# EAGLE schematic mbc_90_23_11_25_dc (EAGLE 7.6.0)

## Sheet 1 of 3
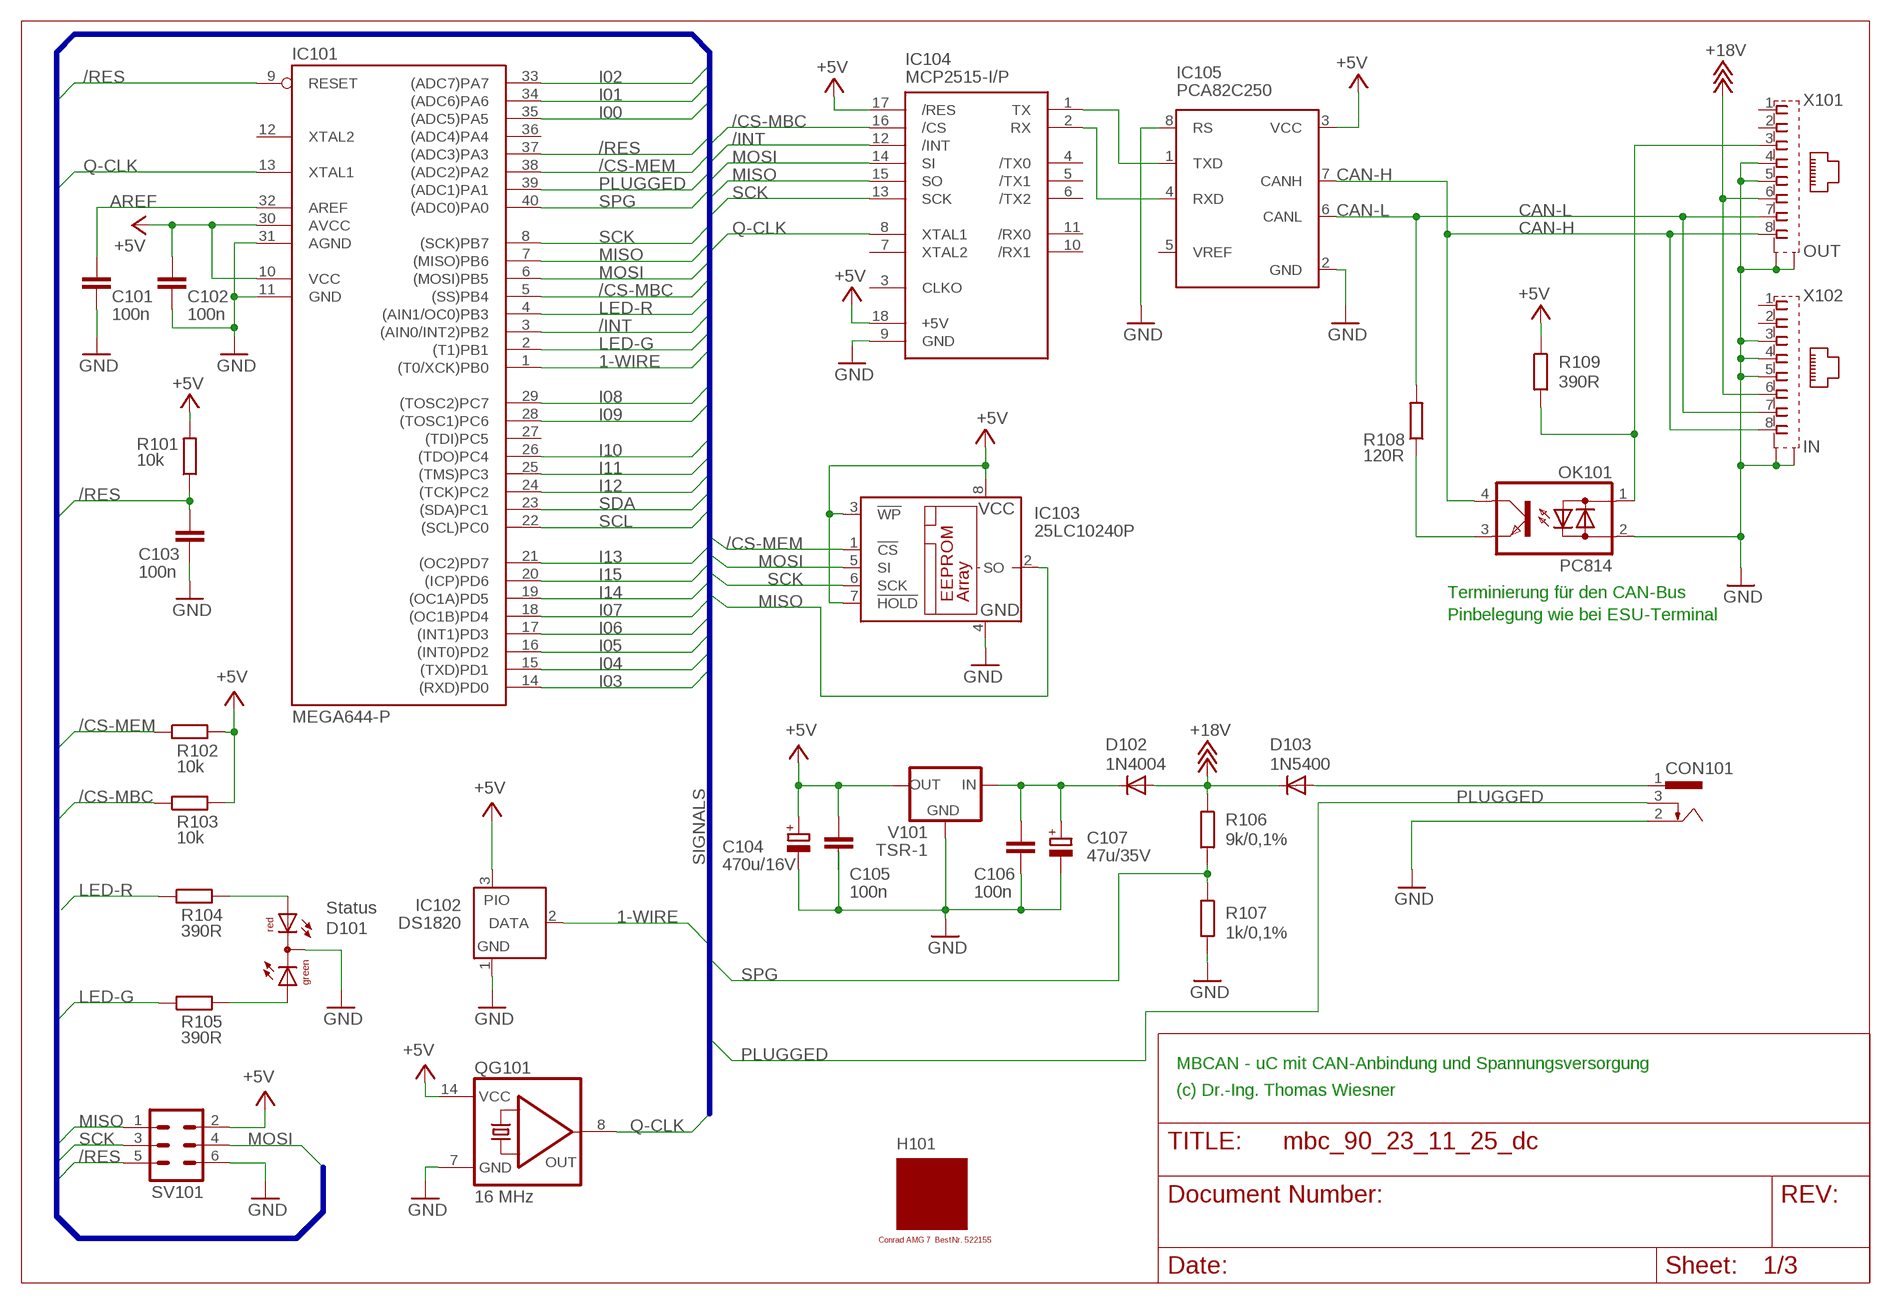
[diagram p0: schematic, sheet 1]

### Parts
C101  100n  C-EU025-025X050  [C025-025X050]
C102  100n  C-EU025-025X050  [C025-025X050]
C103  100n  C-EU025-025X050  [C025-025X050]
C104  470u/16V  CPOL-EUE3.5-8  [E3,5-8]
C105  100n  C-EU025-025X050  [C025-025X050]
C106  100n  C-EU025-025X050  [C025-025X050]
C107  47u/35V  CPOL-EUE2.5-7  [E2,5-7]
CON101  POWER-JACK  [POWER-JACK]
D101  Status  DUOLED5MM  [DUOLED5MM]
D102  1N4004  [DO41-10]
D103  1N5400  [DO201-15]
H101  MODULGEHÄUSE-AMG-7  [MODULGEHÄUSE-1]
IC101  MEGA644-P  MEGA323-P  [DIL40]
IC102  DS1820  DS2405  [TO92-]
IC103  25LC10240P  25LC040P  [DIL8]
IC104  MCP2515-I/P  MCP2510-I/P  [DIL18]
IC105  PCA82C250  [DIL08]
OK101  PC814  [DIL04]
QG101  16 MHz  QG5860  [DIL14S]
R101  10k  R-EU_0207/10  [0207/10]
R102  10k  R-EU_0207/10  [0207/10]
R103  10k  R-EU_0207/10  [0207/10]
R104  390R  R-EU_0207/10  [0207/10]
R105  390R  R-EU_0207/10  [0207/10]
R106  9k/0,1%  R-EU_0207/10  [0207/10]
R107  1k/0,1%  R-EU_0207/10  [0207/10]
R108  120R  R-EU_0207/10  [0207/10]
R109  390R  R-EU_0207/10  [0207/10]
SV101  ML6  [ML6]
V101  TSR-1  [TRACO-TSR-1]
X101  OUT  0446200002  [0446200002]
X102  IN  0446200002  [0446200002]

### Nets
1-WIRE: IC101.1((T0/XCK)PB0) IC102.2(DATA)
+5V: C102.1 C104.+ C105.1 IC101.10(VCC) IC101.30(AVCC) IC102.3(PIO) IC103.3(!WP) IC103.7(!HOLD) IC103.8(VCC) IC104.17(/RES) IC104.18(+5V) IC105.3(VCC) QG101.14(VCC) R101.2 R102.2 R103.2 R109.1 SV101.2 V101.OUT ; also sheet 2
+18V: D102.A D103.C R106.1 X101.6 X102.6
/CS-MBC: IC101.5((SS)PB4) IC104.16(/CS) R103.1
/CS-MEM: IC101.38((ADC2)PA2) IC103.1(!CS) R102.1
/INT: IC101.3((AIN0/INT2)PB2) IC104.12(/INT)
/RES: C103.1 IC101.9(RESET) IC101.37((ADC3)PA3) R101.1 SV101.5
AREF: C101.1 IC101.32(AREF)
CAN-H: IC105.7(CANH) OK101.4(C) X101.8 X102.8
CAN-L: IC105.6(CANL) R108.2 X101.7 X102.7
GND: C101.2 C102.2 C103.2 C104.- C105.2 C106.2 C107.- CON101.2 D101.K(C) IC101.11(GND) IC101.31(AGND) IC102.1(GND) IC103.4(GND) IC104.9(GND) IC105.2(GND) IC105.8(RS) QG101.7(GND) R107.2 SV101.6 V101.GND X101.4 X101.5 X101.S@1(S1) X101.S@2(S2) X102.3 X102.4 X102.5 X102.S@1(S1) X102.S@2(S2) ; also sheet 2
I00: IC101.35((ADC5)PA5) ; also sheet 2
I01: IC101.34((ADC6)PA6) ; also sheet 2
I02: IC101.33((ADC7)PA7) ; also sheet 2
I03: IC101.14((RXD)PD0) ; also sheet 2
I04: IC101.15((TXD)PD1) ; also sheet 2
I05: IC101.16((INT0)PD2) ; also sheet 2
I06: IC101.17((INT1)PD3) ; also sheet 2
I07: IC101.18((OC1B)PD4) ; also sheet 2
I08: IC101.29((TOSC2)PC7) ; also sheet 2
I09: IC101.28((TOSC1)PC6) ; also sheet 2
I10: IC101.26((TDO)PC4) ; also sheet 2
I11: IC101.25((TMS)PC3) ; also sheet 2
I12: IC101.24((TCK)PC2) ; also sheet 2
I13: IC101.21((OC2)PD7) ; also sheet 2
I14: IC101.19((OC1A)PD5) ; also sheet 2
I15: IC101.20((ICP)PD6) ; also sheet 2
LED-G: IC101.2((T1)PB1) R105.1
LED-R: IC101.4((AIN1/OC0)PB3) R104.1
MISO: IC101.7((MISO)PB6) IC103.2(SO) IC104.15(SO) SV101.1
MOSI: IC101.6((MOSI)PB5) IC103.5(SI) IC104.14(SI) SV101.4
N$1: IC104.1(TX) IC105.1(TXD)
N$2: IC104.2(RX) IC105.4(RXD)
N$4: OK101.3(E) R108.1
N$6: C106.1 C107.+ D102.C V101.IN
N$7: OK101.1(AC1) R109.2 X101.3
N$9: D101.AR R104.2
N$13: D101.AG R105.2
PLUGGED: CON101.3 IC101.39((ADC1)PA1)
Q-CLK: IC101.13(XTAL1) IC104.8(XTAL1) QG101.8(OUT)
SCK: IC101.8((SCK)PB7) IC103.6(SCK) IC104.13(SCK) SV101.3
SCL: IC101.22((SCL)PC0) ; also sheet 2
SDA: IC101.23((SDA)PC1) ; also sheet 2
SPG: IC101.40((ADC0)PA0) R106.2 R107.1
V-NETZTEIL1: CON101.1 D103.A
Unconnected: IC101.12(XTAL2) IC101.27((TDI)PC5) IC101.36((ADC4)PA4) IC104.3(CLKO) IC104.4(/TX0) IC104.5(/TX1) IC104.6(/TX2) IC104.7(XTAL2) IC104.10(/RX1) IC104.11(/RX0) IC105.5(VREF) OK101.2(AC2) X101.1 X101.2 X102.1 X102.2

### Buses
SIGNALS

### Notes on the sheet
- Terminierung für den CAN-Bus
- Pinbelegung wie bei ESU-Terminal
- MBCAN - uC mit CAN-Anbindung und Spannungsversorgung
- (c) Dr.-Ing. Thomas Wiesner

## Sheet 2 of 3
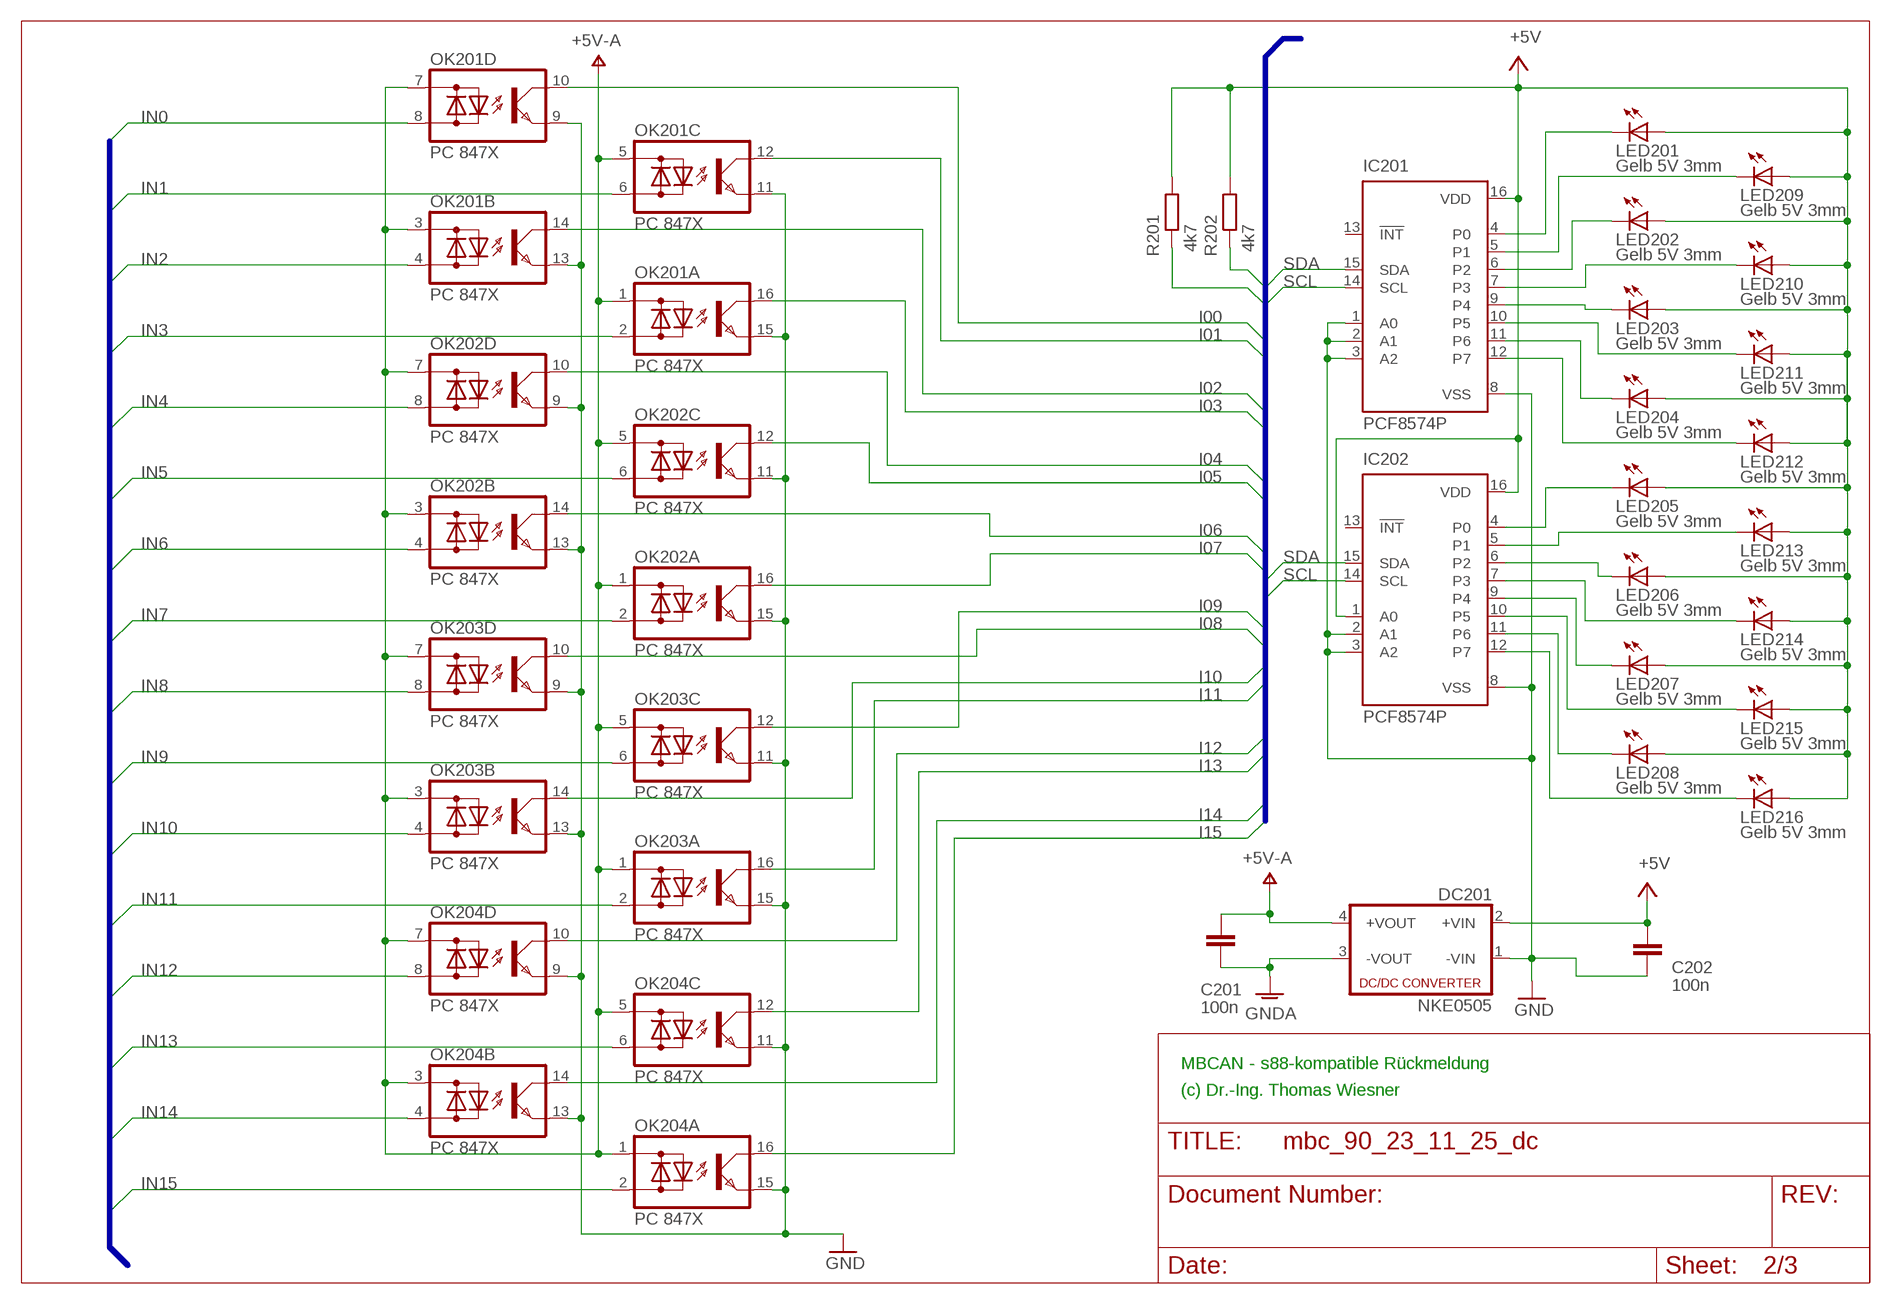
[diagram p1: schematic, sheet 2]

### Parts
C201  100n  C-EU025-025X050  [C025-025X050]
C202  100n  C-EU025-025X050  [C025-025X050]
DC201  NKE0505  NME  [NME]
IC201  PCF8574P  [DIL16]
IC202  PCF8574P  [DIL16]
LED201  Gelb 5V 3mm  LED3MM  [LED3MM]
LED202  Gelb 5V 3mm  LED3MM  [LED3MM]
LED203  Gelb 5V 3mm  LED3MM  [LED3MM]
LED204  Gelb 5V 3mm  LED3MM  [LED3MM]
LED205  Gelb 5V 3mm  LED3MM  [LED3MM]
LED206  Gelb 5V 3mm  LED3MM  [LED3MM]
LED207  Gelb 5V 3mm  LED3MM  [LED3MM]
LED208  Gelb 5V 3mm  LED3MM  [LED3MM]
LED209  Gelb 5V 3mm  LED3MM  [LED3MM]
LED210  Gelb 5V 3mm  LED3MM  [LED3MM]
LED211  Gelb 5V 3mm  LED3MM  [LED3MM]
LED212  Gelb 5V 3mm  LED3MM  [LED3MM]
LED213  Gelb 5V 3mm  LED3MM  [LED3MM]
LED214  Gelb 5V 3mm  LED3MM  [LED3MM]
LED215  Gelb 5V 3mm  LED3MM  [LED3MM]
LED216  Gelb 5V 3mm  LED3MM  [LED3MM]
OK201  PC 847X  TIL196  [DIL16]
OK202  PC 847X  TIL196  [DIL16]
OK203  PC 847X  TIL196  [DIL16]
OK204  PC 847X  TIL196  [DIL16]
R201  4k7  R-EU_0207/10  [0207/10]
R202  4k7  R-EU_0207/10  [0207/10]

### Nets
+5V: C202.1 DC201.2(+VIN) IC201.16(VDD) IC202.1(A0) IC202.16(VDD) LED201.A LED202.A LED203.A LED204.A LED205.A LED206.A LED207.A LED208.A LED209.A LED210.A LED211.A LED212.A LED213.A LED214.A LED215.A LED216.A R201.2 R202.2 ; also sheet 1
GND: C202.2 DC201.1(-VIN) IC201.1(A0) IC201.2(A1) IC201.3(A2) IC201.8(VSS) IC202.2(A1) IC202.3(A2) IC202.8(VSS) OK201.9(D:E) OK201.11(C:E) OK201.13(B:E) OK201.15(A:E) OK202.9(D:E) OK202.11(C:E) OK202.13(B:E) OK202.15(A:E) OK203.9(D:E) OK203.11(C:E) OK203.13(B:E) OK203.15(A:E) OK204.9(D:E) OK204.11(C:E) OK204.13(B:E) OK204.15(A:E) ; also sheet 1
GNDA: C201.2 DC201.3(-VOUT) ; also sheet 3
I00: OK201.10(D:C) ; also sheet 1
I01: OK201.12(C:C) ; also sheet 1
I02: OK201.14(B:C) ; also sheet 1
I03: OK201.16(A:C) ; also sheet 1
I04: OK202.10(D:C) ; also sheet 1
I05: OK202.12(C:C) ; also sheet 1
I06: OK202.14(B:C) ; also sheet 1
I07: OK202.16(A:C) ; also sheet 1
I08: OK203.10(D:C) ; also sheet 1
I09: OK203.12(C:C) ; also sheet 1
I10: OK203.14(B:C) ; also sheet 1
I11: OK203.16(A:C) ; also sheet 1
I12: OK204.10(D:C) ; also sheet 1
I13: OK204.12(C:C) ; also sheet 1
I14: OK204.14(B:C) ; also sheet 1
I15: OK204.16(A:C) ; also sheet 1
IN0: OK201.8(D:AC2) ; also sheet 3
IN1: OK201.6(C:AC2) ; also sheet 3
IN2: OK201.4(B:AC2) ; also sheet 3
IN3: OK201.2(A:AC2) ; also sheet 3
IN4: OK202.8(D:AC2) ; also sheet 3
IN5: OK202.6(C:AC2) ; also sheet 3
IN6: OK202.4(B:AC2) ; also sheet 3
IN7: OK202.2(A:AC2) ; also sheet 3
IN8: OK203.8(D:AC2) ; also sheet 3
IN9: OK203.6(C:AC2) ; also sheet 3
IN10: OK203.4(B:AC2) ; also sheet 3
IN11: OK203.2(A:AC2) ; also sheet 3
IN12: OK204.8(D:AC2) ; also sheet 3
IN13: OK204.6(C:AC2) ; also sheet 3
IN14: OK204.4(B:AC2) ; also sheet 3
IN15: OK204.2(A:AC2) ; also sheet 3
N$15: IC201.9(P4) LED203.K(C)
N$31: IC201.10(P5) LED211.K(C)
N$49: IC202.4(P0) LED205.K(C)
N$50: IC201.4(P0) LED201.K(C)
N$51: IC201.5(P1) LED209.K(C)
N$52: IC201.6(P2) LED202.K(C)
N$53: IC201.7(P3) LED210.K(C)
N$54: IC201.11(P6) LED204.K(C)
N$55: IC201.12(P7) LED212.K(C)
N$56: IC202.9(P4) LED207.K(C)
N$57: IC202.5(P1) LED213.K(C)
N$58: IC202.6(P2) LED206.K(C)
N$59: IC202.7(P3) LED214.K(C)
N$60: IC202.10(P5) LED215.K(C)
N$61: IC202.11(P6) LED208.K(C)
N$62: IC202.12(P7) LED216.K(C)
SCL: IC201.14(SCL) IC202.14(SCL) R201.1 ; also sheet 1
SDA: IC201.15(SDA) IC202.15(SDA) R202.1 ; also sheet 1
V+: C201.1 DC201.4(+VOUT) OK201.1(A:AC1) OK201.3(B:AC1) OK201.5(C:AC1) OK201.7(D:AC1) OK202.1(A:AC1) OK202.3(B:AC1) OK202.5(C:AC1) OK202.7(D:AC1) OK203.1(A:AC1) OK203.3(B:AC1) OK203.5(C:AC1) OK203.7(D:AC1) OK204.1(A:AC1) OK204.3(B:AC1) OK204.5(C:AC1) OK204.7(D:AC1) ; supply symbol labelled +5V-A
Unconnected: IC201.13(!INT) IC202.13(!INT)

### Buses
B$1
B$2

### Notes on the sheet
- MBCAN - s88-kompatible Rückmeldung
- (c) Dr.-Ing. Thomas Wiesner

## Sheet 3 of 3
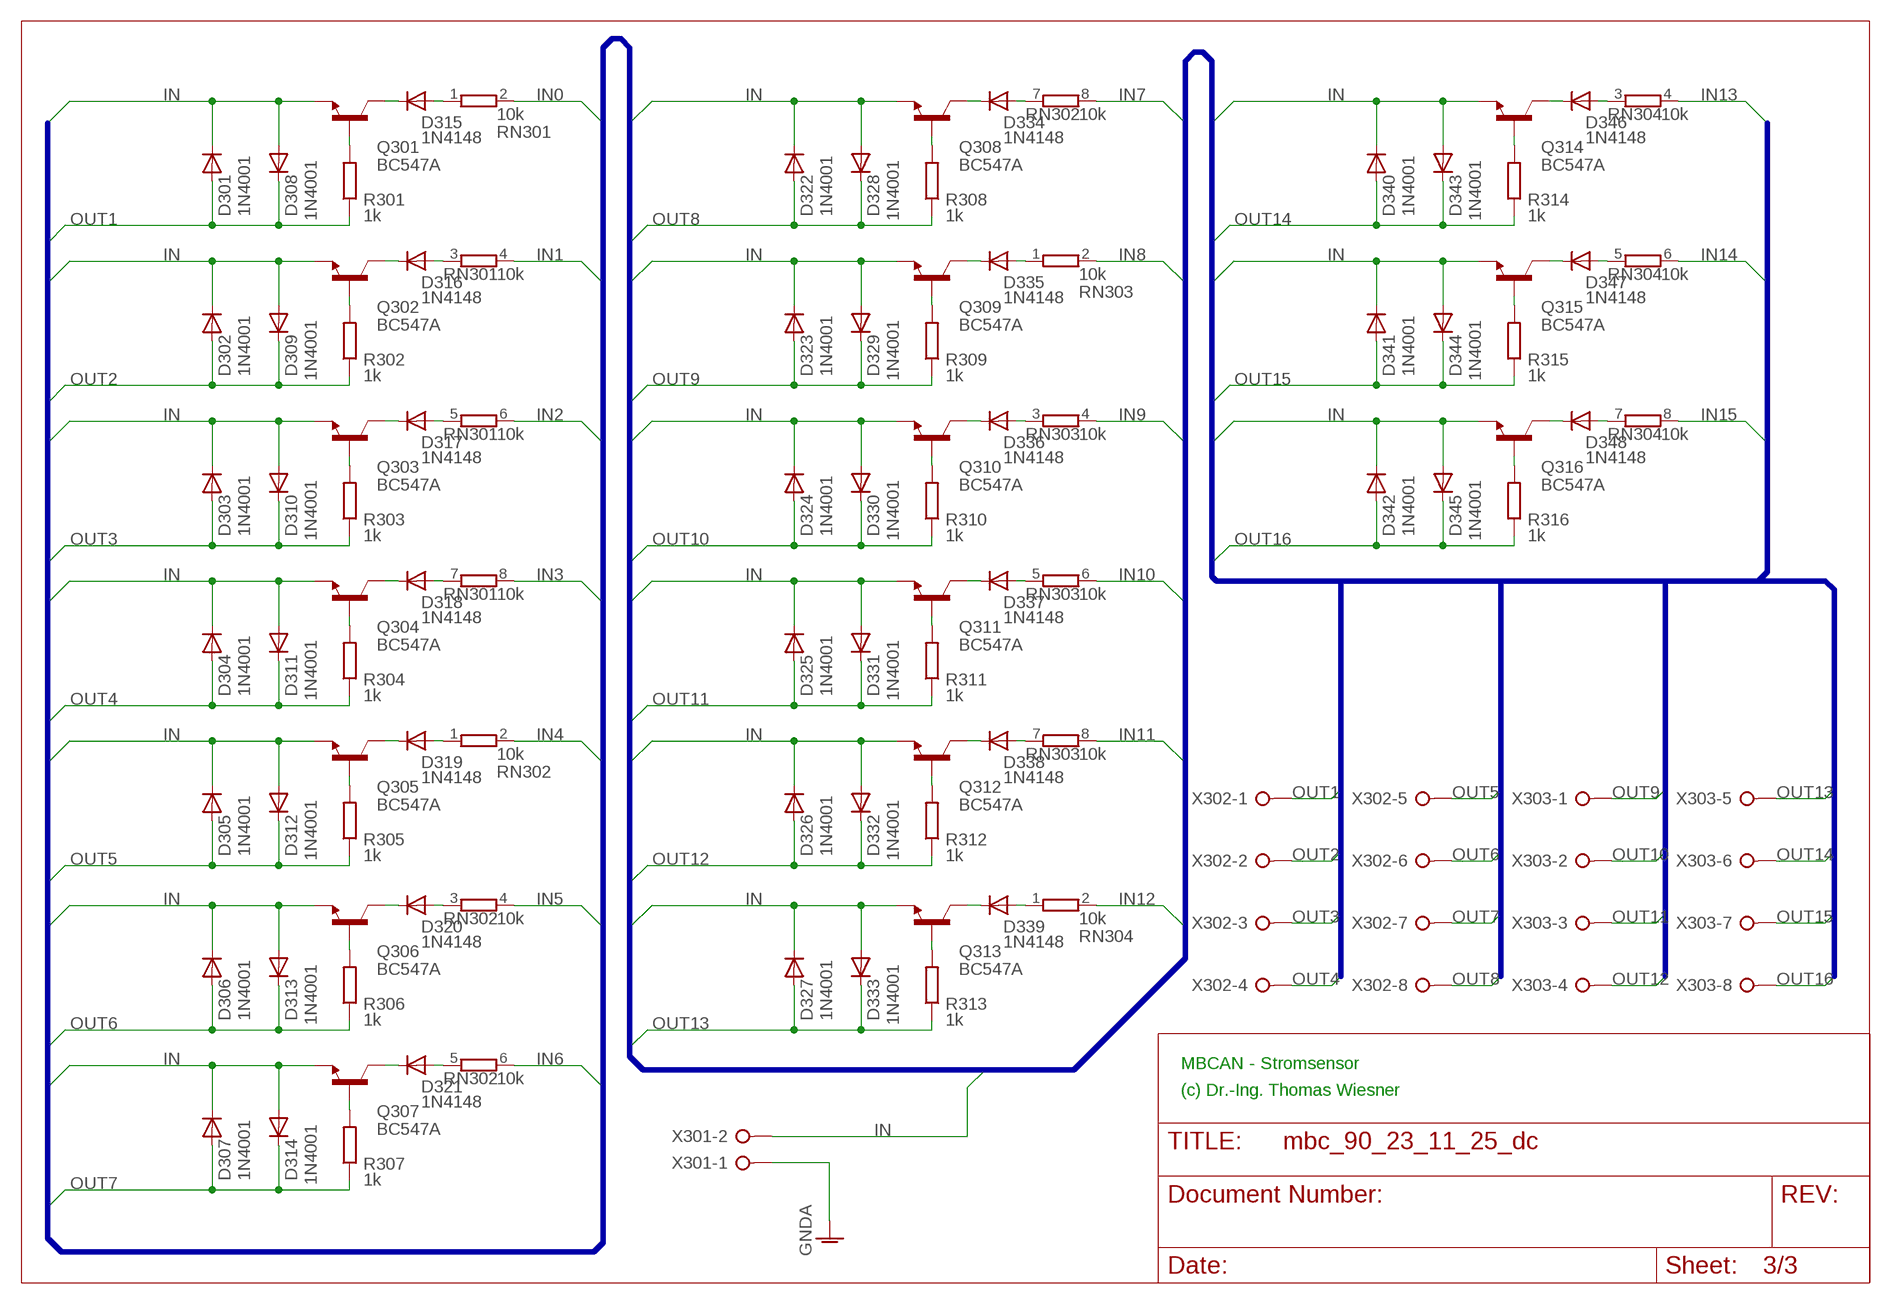
[diagram p2: schematic, sheet 3]

### Parts
D301  1N4001  1N4004  [DO41-10]
D302  1N4001  1N4004  [DO41-10]
D303  1N4001  1N4004  [DO41-10]
D304  1N4001  1N4004  [DO41-10]
D305  1N4001  1N4004  [DO41-10]
D306  1N4001  1N4004  [DO41-10]
D307  1N4001  1N4004  [DO41-10]
D308  1N4001  1N4004  [DO41-10]
D309  1N4001  1N4004  [DO41-10]
D310  1N4001  1N4004  [DO41-10]
D311  1N4001  1N4004  [DO41-10]
D312  1N4001  1N4004  [DO41-10]
D313  1N4001  1N4004  [DO41-10]
D314  1N4001  1N4004  [DO41-10]
D315  1N4148  1N4148DO35-10  [DO35-10]
D316  1N4148  1N4148DO35-10  [DO35-10]
D317  1N4148  1N4148DO35-10  [DO35-10]
D318  1N4148  1N4148DO35-10  [DO35-10]
D319  1N4148  1N4148DO35-10  [DO35-10]
D320  1N4148  1N4148DO35-10  [DO35-10]
D321  1N4148  1N4148DO35-10  [DO35-10]
D322  1N4001  1N4004  [DO41-10]
D323  1N4001  1N4004  [DO41-10]
D324  1N4001  1N4004  [DO41-10]
D325  1N4001  1N4004  [DO41-10]
D326  1N4001  1N4004  [DO41-10]
D327  1N4001  1N4004  [DO41-10]
D328  1N4001  1N4004  [DO41-10]
D329  1N4001  1N4004  [DO41-10]
D330  1N4001  1N4004  [DO41-10]
D331  1N4001  1N4004  [DO41-10]
D332  1N4001  1N4004  [DO41-10]
D333  1N4001  1N4004  [DO41-10]
D334  1N4148  1N4148DO35-10  [DO35-10]
D335  1N4148  1N4148DO35-10  [DO35-10]
D336  1N4148  1N4148DO35-10  [DO35-10]
D337  1N4148  1N4148DO35-10  [DO35-10]
D338  1N4148  1N4148DO35-10  [DO35-10]
D339  1N4148  1N4148DO35-10  [DO35-10]
D340  1N4001  1N4004  [DO41-10]
D341  1N4001  1N4004  [DO41-10]
D342  1N4001  1N4004  [DO41-10]
D343  1N4001  1N4004  [DO41-10]
D344  1N4001  1N4004  [DO41-10]
D345  1N4001  1N4004  [DO41-10]
D346  1N4148  1N4148DO35-10  [DO35-10]
D347  1N4148  1N4148DO35-10  [DO35-10]
D348  1N4148  1N4148DO35-10  [DO35-10]
Q301  BC547A  [TO92]
Q302  BC547A  [TO92]
Q303  BC547A  [TO92]
Q304  BC547A  [TO92]
Q305  BC547A  [TO92]
Q306  BC547A  [TO92]
Q307  BC547A  [TO92]
Q308  BC547A  [TO92]
Q309  BC547A  [TO92]
Q310  BC547A  [TO92]
Q311  BC547A  [TO92]
Q312  BC547A  [TO92]
Q313  BC547A  [TO92]
Q314  BC547A  [TO92]
Q315  BC547A  [TO92]
Q316  BC547A  [TO92]
R301  1k  R-EU_0207/10  [0207/10]
R302  1k  R-EU_0207/10  [0207/10]
R303  1k  R-EU_0207/10  [0207/10]
R304  1k  R-EU_0207/10  [0207/10]
R305  1k  R-EU_0207/10  [0207/10]
R306  1k  R-EU_0207/10  [0207/10]
R307  1k  R-EU_0207/10  [0207/10]
R308  1k  R-EU_0207/10  [0207/10]
R309  1k  R-EU_0207/10  [0207/10]
R310  1k  R-EU_0207/10  [0207/10]
R311  1k  R-EU_0207/10  [0207/10]
R312  1k  R-EU_0207/10  [0207/10]
R313  1k  R-EU_0207/10  [0207/10]
R314  1k  R-EU_0207/10  [0207/10]
R315  1k  R-EU_0207/10  [0207/10]
R316  1k  R-EU_0207/10  [0207/10]
RN301  10k  E4RP  [SIL8]
RN302  10k  E4RP  [SIL8]
RN303  10k  E4RP  [SIL8]
RN304  10k  E4RP  [SIL8]
X301  W237-02P  [W237-132]
X302  W237-08P  [W237-8P]
X303  W237-08P  [W237-8P]

### Nets
GNDA: X301.1 ; also sheet 2
IN: D301.C D302.C D303.C D304.C D305.C D306.C D307.C D308.A D309.A D310.A D311.A D312.A D313.A D314.A D322.C D323.C D324.C D325.C D326.C D327.C D328.A D329.A D330.A D331.A D332.A D333.A D340.C D341.C D342.C D343.A D344.A D345.A Q301.1(E) Q302.1(E) Q303.1(E) Q304.1(E) Q305.1(E) Q306.1(E) Q307.1(E) Q308.1(E) Q309.1(E) Q310.1(E) Q311.1(E) Q312.1(E) Q313.1(E) Q314.1(E) Q315.1(E) Q316.1(E) X301.2
IN0: RN301.2 ; also sheet 2
IN1: RN301.4 ; also sheet 2
IN2: RN301.6 ; also sheet 2
IN3: RN301.8 ; also sheet 2
IN4: RN302.2 ; also sheet 2
IN5: RN302.4 ; also sheet 2
IN6: RN302.6 ; also sheet 2
IN7: RN302.8 ; also sheet 2
IN8: RN303.2 ; also sheet 2
IN9: RN303.4 ; also sheet 2
IN10: RN303.6 ; also sheet 2
IN11: RN303.8 ; also sheet 2
IN12: RN304.2 ; also sheet 2
IN13: RN304.4 ; also sheet 2
IN14: RN304.6 ; also sheet 2
IN15: RN304.8 ; also sheet 2
N$3: Q302.2(B) R302.2
N$5: D316.C Q302.3(C)
N$8: D316.A RN301.3
N$10: Q303.2(B) R303.2
N$11: D317.C Q303.3(C)
N$12: D317.A RN301.5
N$14: Q304.2(B) R304.2
N$16: D318.C Q304.3(C)
N$17: D318.A RN301.7
N$18: Q305.2(B) R305.2
N$19: D319.C Q305.3(C)
N$20: D319.A RN302.1
N$21: Q306.2(B) R306.2
N$22: D320.C Q306.3(C)
N$23: D320.A RN302.3
N$24: Q307.2(B) R307.2
N$25: D321.C Q307.3(C)
N$26: D321.A RN302.5
N$27: Q301.2(B) R301.2
N$28: Q308.2(B) R308.2
N$29: D334.C Q308.3(C)
N$30: D334.A RN302.7
N$32: Q309.2(B) R309.2
N$33: D315.C Q301.3(C)
N$34: D335.C Q309.3(C)
N$35: D335.A RN303.1
N$36: Q310.2(B) R310.2
N$37: D336.C Q310.3(C)
N$38: D315.A RN301.1
N$39: D336.A RN303.3
N$40: Q311.2(B) R311.2
N$41: D337.C Q311.3(C)
N$42: D337.A RN303.5
N$43: Q312.2(B) R312.2
N$44: D338.C Q312.3(C)
N$45: D338.A RN303.7
N$46: Q313.2(B) R313.2
N$47: D339.C Q313.3(C)
N$48: D339.A RN304.1
N$63: Q314.2(B) R314.2
N$64: D346.C Q314.3(C)
N$65: D346.A RN304.3
N$66: Q315.2(B) R315.2
N$67: D347.C Q315.3(C)
N$68: D347.A RN304.5
N$69: Q316.2(B) R316.2
N$70: D348.C Q316.3(C)
N$71: D348.A RN304.7
OUT1: D301.A D308.C R301.1 X302.1
OUT2: D302.A D309.C R302.1 X302.2
OUT3: D303.A D310.C R303.1 X302.3
OUT4: D304.A D311.C R304.1 X302.4
OUT5: D305.A D312.C R305.1 X302.5
OUT6: D306.A D313.C R306.1 X302.6
OUT7: D307.A D314.C R307.1 X302.7
OUT8: D322.A D328.C R308.1 X302.8
OUT9: D323.A D329.C R309.1 X303.1
OUT10: D324.A D330.C R310.1 X303.2
OUT11: D325.A D331.C R311.1 X303.3
OUT12: D326.A D332.C R312.1 X303.4
OUT13: D327.A D333.C R313.1 X303.5
OUT14: D340.A D343.C R314.1 X303.6
OUT15: D341.A D344.C R315.1 X303.7
OUT16: D342.A D345.C R316.1 X303.8

### Buses
B$4

### Notes on the sheet
- MBCAN - Stromsensor
- (c) Dr.-Ing. Thomas Wiesner

## Library data of the parts
C101-C103 C105 C106 C201 C202 = rcl:C-EU: CAPACITOR, European symbol
C104 C107 = rcl:CPOL-EU: POLARIZED CAPACITOR, European symbol
CON101 = mbc:POWER-JACK: Power-Stecker für 2,5 mm Hohlbuchse
D101 = led:DUOLED5MM: DUO LED 2 colors, 5 mm, round
D102 D301-D314 D322-D333 D340-D345 = diode:1N4004: DIODE general purpose rectifier, 1 A
D103 = diode:1N5400: DIODE standard rectifier, 3 A, 50 V (Motorola)
D315-D321 D334-D339 D346-D348 = diode:1N4148: DIODE high speed (Philips)
DC201 = dc-dc-converter:NME: DC-DC CONVERTER; MF: C & D TECHNOLOGIES, INC; MPN: NME1205D; OC_FARNELL: 1021466; OC_NEWARK: 98B8198
H101 = mbc:MODULGEHÄUSE-AMG-7: Gehäuse Conrad AMG 7 BestNr. 522155
IC101 = atmel:MEGA323-P: MICROCONTROLLER 32 Kbytes FLASH 2 Kbytes SRAM 1 Kbytes EEPROM USART 8-channel 10 bit ADC Source: avr.lbr; OC_FARNELL: unknown; OC_NEWARK: unknown
IC102 = maxim:DS2405: Addressable Switch DALLAS Semiconductor; MF: DALLAS SEMICONDUCTOR; MPN: DS2405; OC_FARNELL: 1188025; OC_NEWARK: 06F4645
IC103 = microchip:25*: Serial EEPROM 4K/ 8K , SPI bus; MF: MICROCHIP; MPN: 25LC040/P; OC_FARNELL: 9758100; OC_NEWARK: 96K4091
IC104 = mbc:MCP2510: BASIC-CAN 2.0a Controller Stand-alone CAN controller von Microchip
IC105 = micro-philips:PCA82C250: CAN CONTROLLER INTERFACE; OC_FARNELL: 3692358; OC_NEWARK: unknown
IC201 IC202 = micro-philips:PCF8574: I2C-Bus Remote 8-bit I/O expander http://www.semiconductors.philips.com/acrobat_download/datasheets/PCF8574_4.pdf; MPN: PCF8574PN; OC_FARNELL: 204020; OC_NEWARK: 11N8515
LED201-LED216 = led:LED: LED OSRAM: - CHIPLED LG R971, LG N971, LY N971, LG Q971, LY Q971, LO R971, LY R971 LH N974, LH R974 LS Q976, LO Q976, LY Q976 LO Q996 - Hyper CHIPLED LW Q18S LB Q993, LB Q99A, LB R99A - SideLED LS A670, LO A670, LY A670, LG A670, LP A670 LB A673, LV A673, LT A673, LW A673 LH A674 LY A675 LS A676, LA A676, LO A676, LY A676, LW A676 LS A679, LY A679, LG A679 - Hyper Micro SIDELED® LS Y876, LA Y876, LO Y876, LY Y876 LT Y87S - SmartLED LW L88C, LW L88S LB L89C, LB L89S, LG L890 LS L89K, LO L89K, LY L89K LS L896, LA L896, LO L896, LY L896 - TOPLED LS T670, LO T670, LY T670, LG T670, LP T670 LSG T670, LSP T670, LSY T670, LOP T670, LYG T670 LG T671, LOG T671, LSG T671 LB T673, LV T673, LT T673, LW T673 LH T674 LS T676, LA T676, LO T676, LY T676, LB T676, LH T676, LSB T676, LW T676 LB T67C, LV T67C, LT T67C, LS T67K, LO T67K, LY T67K, LW E67C LS E67B, LA E67B, LO E67B, LY E67B, LB E67C, LV E67C, LT E67C LW T67C LS T679, LY T679, LG T679 LS T770, LO T770, LY T770, LG T770, LP T770 LB T773, LV T773, LT T773, LW T773 LH T774 LS E675, LA E675, LY E675, LS T675 LS T776, LA T776, LO T776, LY T776, LB T776 LHGB T686 LT T68C, LB T68C - Hyper Mini TOPLED® LB M676 - Mini TOPLED Santana® LG M470 LS M47K, LO M47K, LY M47K Source: http://www.osram.convergy.de LUXEON: - LUMILED® LXK2-PW12-R00, LXK2-PW12-S00, LXK2-PW14-U00, LXK2-PW14-V00 LXK2-PM12-R00, LXK2-PM12-S00, LXK2-PM14-U00 LXK2-PE12-Q00, LXK2-PE12-R00, LXK2-PE12-S00, LXK2-PE14-T00, LXK2-PE14-U00 LXK2-PB12-K00, LXK2-PB12-L00, LXK2-PB12-M00, LXK2-PB14-N00, LXK2-PB14-P00, LXK2-PB14-Q00 LXK2-PR12-L00, LXK2-PR12-M00, LXK2-PR14-Q00, LXK2-PR14-R00 LXK2-PD12-Q00, LXK2-PD12-R00, LXK2-PD12-S00 LXK2-PH12-R00, LXK2-PH12-S00 LXK2-PL12-P00, LXK2-PL12-Q00, LXK2-PL12-R00 Source: www.luxeon.com KINGBRIGHT: KA-3528ASYC Source: www.kingbright.com
OK101 = optocoupler:PC814: SHARP OPTO COUPLER; OC_FARNELL: 9707662; OC_NEWARK: unknown
OK201-OK204 = optocoupler:TIL196: TEXAS INSTRUMENTS OPTO COUPLER; MPN: TIL 196; OC_FARNELL: 1683367; OC_NEWARK: 05R6476
Q301-Q316 = transistor-npn:BC547*: NPN Transistor
QG101 = crystal:QG5860: CRYSTAL RESONATOR; OC_FARNELL: unknown; OC_NEWARK: unknown
R101-R109 R201 R202 R301-R316 = resistor:R-EU_: RESISTOR, European symbol
RN301-RN304 = resistor-sil:E4RP: SIL RESISTOR; OC_FARNELL: unknown; OC_NEWARK: unknown
SV101 = con-ml:ML6: HARTING; OC_FARNELL: unknown; OC_NEWARK: unknown
V101 = mbc:TSR-1: Spannungsregler Hersteller: TRACO Typ: TSR-1 5V: TSR 1-2450 Spg: 5V Strom: 1A Reichelt TSR 1-2450
X101 X102 = mbc:0446200002: RJ-45 INVERTED MODULAR JACK ASSEMBLY WITH RJ-11 KEEPOUT FEATURE Source: Data sheet <http://www.farnell.com/datasheets/73207.pdf> MOLEX 0446200002 BUCHSE, RJ45, GESCHIRMT Source: Farnell <http://de.farnell.com/molex/0446200002/buchse-rj45-geschirmt/dp/9251910?ost=9251910>; MF: MOLEX; MPN: 0446200002; OC_FARNELL: 9251910
X301 = con-wago-508:W237-02P: WAGO SREW CLAMP; OC_FARNELL: unknown; OC_NEWARK: unknown
X302 X303 = con-wago-508:W237-08P: WAGO SREW CLAMP; OC_FARNELL: unknown; OC_NEWARK: unknown